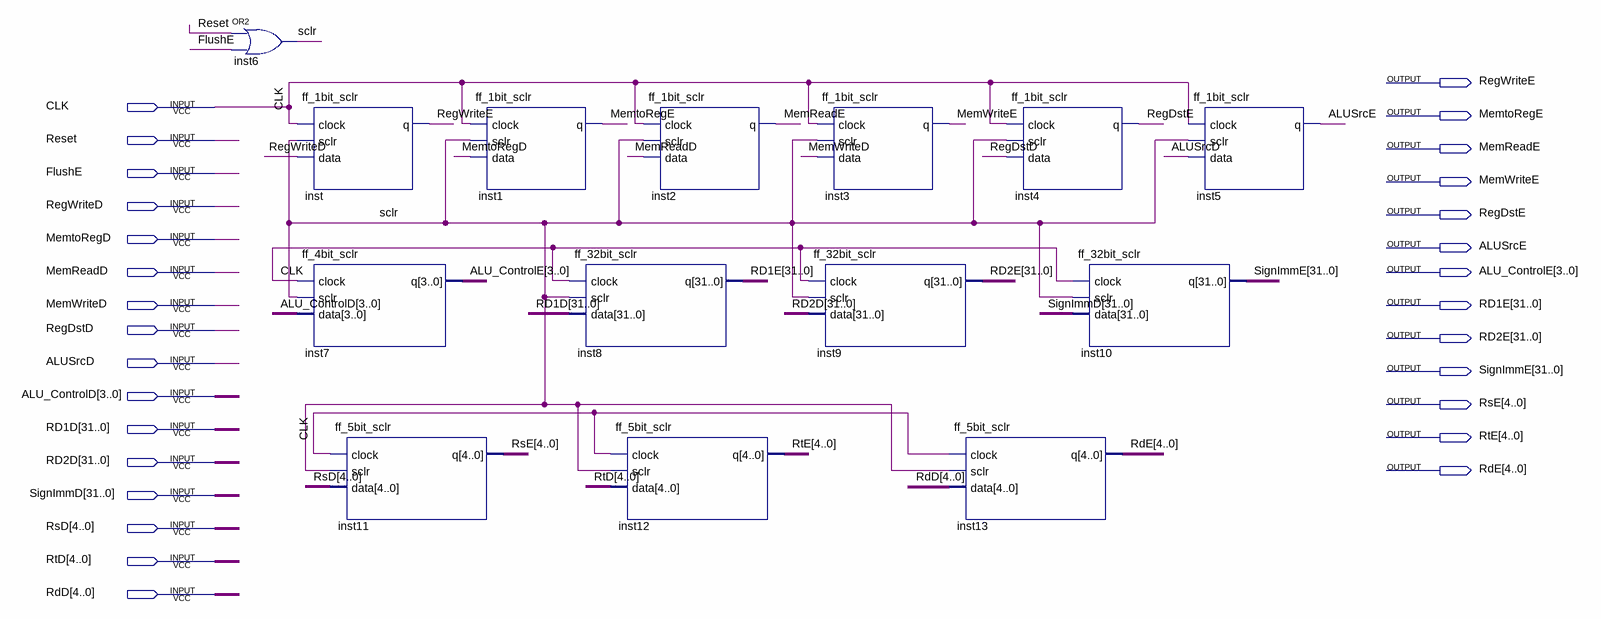
[diagram p0: schematic sheet]
// Quartus schematic ID_EX_Reg.bdf as structural Verilog: 14 symbols, 29 pins
module ID_EX_Reg (
  input  CLK,
  input  Reset,
  input  FlushE,
  input  RegWriteD,
  input  MemtoRegD,
  input  MemReadD,
  input  MemWriteD,
  input  RegDstD,
  input  ALUSrcD,
  input  [3:0] ALU_ControlD,
  input  [31:0] RD1D,
  input  [31:0] RD2D,
  input  [31:0] SignImmD,
  input  [4:0] RsD,
  input  [4:0] RtD,
  input  [4:0] RdD,
  output RegWriteE,
  output MemtoRegE,
  output MemReadE,
  output MemWriteE,
  output RegDstE,
  output ALUSrcE,
  output [3:0] ALU_ControlE,
  output [31:0] RD1E,
  output [31:0] RD2E,
  output [31:0] SignImmE,
  output [4:0] RsE,
  output [4:0] RtE,
  output [4:0] RdE
);

  wire sclr;

  or inst6 (sclr, Reset, FlushE);
  ff_1bit_sclr inst (.clock(CLK), .sclr(sclr), .data(RegWriteD), .q(RegWriteE));
  ff_4bit_sclr inst7 (.clock(CLK), .sclr(sclr), .data(ALU_ControlD), .q(ALU_ControlE));
  ff_5bit_sclr inst11 (.clock(CLK), .sclr(sclr), .data(RsD), .q(RsE));
  ff_1bit_sclr inst1 (.clock(CLK), .sclr(sclr), .data(MemtoRegD), .q(MemtoRegE));
  ff_32bit_sclr inst8 (.clock(CLK), .sclr(sclr), .data(RD1D), .q(RD1E));
  ff_1bit_sclr inst2 (.clock(CLK), .sclr(sclr), .data(MemReadD), .q(MemReadE));
  ff_5bit_sclr inst12 (.clock(CLK), .sclr(sclr), .data(RtD), .q(RtE));
  ff_1bit_sclr inst3 (.clock(CLK), .sclr(sclr), .data(MemWriteD), .q(MemWriteE));
  ff_32bit_sclr inst9 (.clock(CLK), .sclr(sclr), .data(RD2D), .q(RD2E));
  ff_5bit_sclr inst13 (.clock(CLK), .sclr(sclr), .data(RdD), .q(RdE));
  ff_1bit_sclr inst4 (.clock(CLK), .sclr(sclr), .data(RegDstD), .q(RegDstE));
  ff_32bit_sclr inst10 (.clock(CLK), .sclr(sclr), .data(SignImmD), .q(SignImmE));
  ff_1bit_sclr inst5 (.clock(CLK), .sclr(sclr), .data(ALUSrcD), .q(ALUSrcE));
endmodule
